# Altium schematic sheet 3_Sensors.schdoc
size 297 x 209 mm; Symbol: Drawing-Symbol_A4; Device: Drawing-Symbol_A4; @Project Name: Irrigation Controller v2; @Page Count: 5; @Update Date: 2026-11-21; @Create Date: 2026-11-21; @Schematic Name: Schematic1; @Page No: 3; @Page Name: 3_Sensors; Company: EasyEDA.com; Version: V1.0; Page Size: A4; @Create Time: 17:28:44; @Update Time: 17:28:44; Border: 1; Width: 1170; Height: 825; Region Start: 1; X Region Count: 6; Y Region Count: 4; Blade Width: 10; Title Block Position: 3; @Board Name: Board1
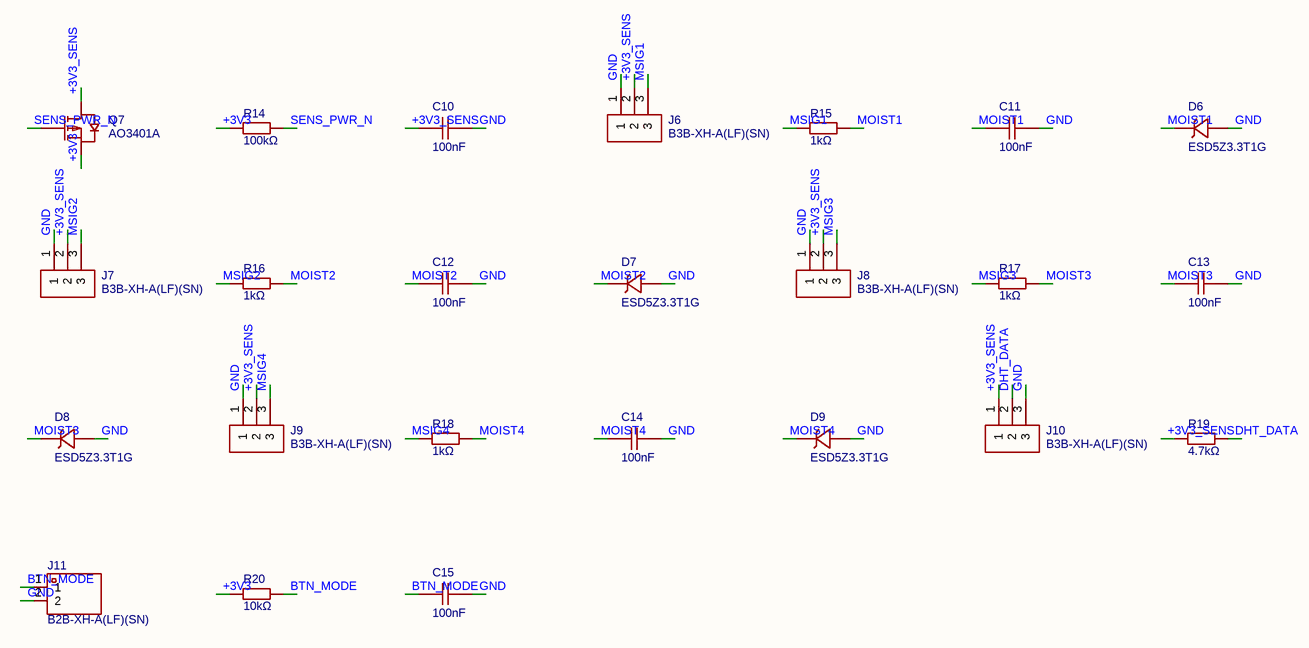
[diagram p0: 3_Sensors.schdoc]

## Parts
C10  100nF  [C0805]
C11  100nF  [C0805]
C12  100nF  [C0805]
C13  100nF  [C0805]
C14  100nF  [C0805]
C15  100nF  [C0805]
D6  ESD5Z3.3T1G  [SOD-523_L1.2-W0.8-LS1.6-FD]
D7  ESD5Z3.3T1G  [SOD-523_L1.2-W0.8-LS1.6-FD]
D8  ESD5Z3.3T1G  [SOD-523_L1.2-W0.8-LS1.6-FD]
D9  ESD5Z3.3T1G  [SOD-523_L1.2-W0.8-LS1.6-FD]
J6  B3B-XH-A(LF)(SN)  [CONN-TH_3P-P2.50_A2501WV2-3P]
J7  B3B-XH-A(LF)(SN)  [CONN-TH_3P-P2.50_A2501WV2-3P]
J8  B3B-XH-A(LF)(SN)  [CONN-TH_3P-P2.50_A2501WV2-3P]
J9  B3B-XH-A(LF)(SN)  [CONN-TH_3P-P2.50_A2501WV2-3P]
J10  B3B-XH-A(LF)(SN)  [CONN-TH_3P-P2.50_A2501WV2-3P]
J11  B2B-XH-A(LF)(SN)  [CONN-TH_B2B-XH-A-LF-SN]
Q7  AO3401A  [SOT-23_L2.9-W1.3-P1.90-LS2.4-BR]
R14  100kΩ  [R0805]
R15  1kΩ  [R0805]
R16  1kΩ  [R0805]
R17  1kΩ  [R0805]
R18  1kΩ  [R0805]
R19  4.7kΩ  [R0805]
R20  10kΩ  [R0805]

## Nets
+3V3: Q7.2(S) R14.1 R20.1
+3V3_SENS: C10.1 J6.2 J7.2 J8.2 J9.2 J10.1 Q7.3(D) R19.1
BTN_MODE: C15.1 J11.1 R20.2
DHT_DATA: J10.2 R19.2
GND: C10.2 C11.2 C12.2 C13.2 C14.2 C15.2 D6.1(A) D7.1(A) D8.1(A) D9.1(A) J6.1 J7.1 J8.1 J9.1 J10.3 J11.2
MOIST1: C11.1 D6.2(K) R15.2
MOIST2: C12.1 D7.2(K) R16.2
MOIST3: C13.1 D8.2(K) R17.2
MOIST4: C14.1 D9.2(K) R18.2
MSIG1: J6.3 R15.1
MSIG2: J7.3 R16.1
MSIG3: J8.3 R17.1
MSIG4: J9.3 R18.1
SENS_PWR_N: Q7.1(G) R14.2

## Notes on the sheet
- Create at
- 2026-11-21
- Schematic
- Board
- Schematic1
- Board1
- Update at
- Page
- 3_Sensors
- Drawn
- Reviewed
- Irrigation Controller v2
- Version
- V1.0
- Size
- A4
- Page  3  Total  5
- EasyEDA.com

## Library data of the parts
C10-C15 = CC0805KRX7R9BB104: Capacitance:100nF Tolerance:±10% Tolerance:±10% Voltage Rating:50V Temperature Coefficient:X7R; Manufacturer: YAGEO(国巨); Add into BOM: yes; PCB Layer: Default; Tolerance: ±10%; Voltage Rating: 50V; Temperature Coefficient: X7R; ModelId: 8c88e81f49c6409b980720ec8953afb6|0819f05c4eef4c71ace90d822a990e87; ModelName: C0805_L2.0-W1.3-H1.3; ModelTransform: 78.74,51.181,0,0,0,0,0,0.0005,0; Symbol: CC0805KRX7R9BB104; Device: CC0805KRX7R9BB104; Convert to PCB: yes; Manufacturer Part: CC0805KRX7R9BB104; Supplier: LCSC; Supplier Part: C49678; LCSC Part Name: 100nF ±10% 50V; Supplier Footprint: 0805; JLCPCB Part Class: Basic Part; Datasheet: https://item.szlcsc.com/datasheet/CC0805KRX7R9BB104/50686.html; Value: 100nF; FootprintName: C0805
D6-D9 = ESD5Z3.3T1G: Polarity:Unidirectional Reverse Stand-Off Voltage (Vrwm):3.3V Clamping Voltage:14V Peak Pulse Current (Ipp):11A Peak Pulse Power Dissipation (Ppp):150W Voltage - Breakdown:5V Reverse Leakage Current (Ir):200nA Number of Channels:1 Operating Temperature:-5; Manufacturer: TECH PUBLIC(台舟); Symbol: ESD5Z3.3T1G_C2827729; Add into BOM: yes; PCB Layer: Default; Reverse Stand-Off Voltage (Vrwm): 3.3V; Clamping Voltage: 14V; Peak Pulse Current (Ipp): 11A; Peak Pulse Power Dissipation (Ppp): 150W; Voltage - Breakdown: 5V; Reverse Leakage Current (Ir): 200nA; Number of Channels: 1; level of protection: IEC 61000-4-2；IEC 61000-4-4; Type: ESD; Junction Capacitance: 110pF; ModelId: c9cd6b3de4464affa41bb10afbd29ee3|0819f05c4eef4c71ace90d822a990e87; ModelName: SOD-523_L1.2-W0.8-H0.7-LS1.6; ModelTransform: 62.992,31.496,0,0,0,0,0,0,0; Device: ESD5Z3.3T1G; Convert to PCB: yes; Manufacturer Part: ESD5Z3.3T1G; Supplier: LCSC; Supplier Part: C2827729; LCSC Part Name: 单向ESD 3.3V截止 峰值浪涌电流：11A; Supplier Footprint: SOD-523; JLCPCB Part Class: Extended Part; Datasheet: https://item.szlcsc.com/datasheet/ESD5Z3.3T1G/2973411.html; Polarity: Unidirectional; Operating Temperature: -55℃~+125℃; FootprintName: SOD-523_L1.2-W0.8-LS1.6-FD
J6-J10 = B3B-XH-A(LF)(SN): Pins Structure:1x3P Pitch:2.5mm Mounting Type:Through Hole Reference Series:XH Number of Pins:3P Number of Rows:1 Number of PINs Per Row:3 Row Spacing:- Current Rating:3A Contact Material:Brass Contact Plating:Tin Operating Temperature:-25℃~+85℃ Operating; Manufacturer: JST; Add into BOM: yes; PCB Layer: Default; Pins Structure: 1x3P; Pitch: 2.5mm; Reference Series: XH; Number of PINs Per Row: 3; Current Rating: 3A; Voltage Rating: 250V; Plastic Material: PA66; Flame Retardant Rating: UL94V-0; Supplementary Features: K Pin; Z-Height of the Board: 7mm; X-Length of Bottom Edge on Board (Spacing Line): 9.9mm; Y-Width of Bottom Edge on Board: 5.75mm; ModelId: 5bef03a823d44d6d8bbe241921219234|0819f05c4eef4c71ace90d822a990e87; ModelTransform: 393.7,226.3775,0,0,0,0,-0.005,-18.465,-125.984; Symbol: B3B-XH-A(LF)(SN); Device: B3B-XH-A(LF)(SN); Convert to PCB: yes; Manufacturer Part: B3B-XH-A(LF)(SN); Supplier: LCSC; Supplier Part: C144394; LCSC Part Name: 1x3P 间距:2.5mm 直插 系列:XH; Supplier Footprint: 插件,P=2.5mm; JLCPCB Part Class: Extended Part; Datasheet: https://item.szlcsc.com/datasheet/B3B-XH-A(LF)(SN)/155726.html; Mounting Type: Through Hole; Number of Pins: 3P; Number of Rows: 1; Row Spacing: -; Contact Material: Brass; Contact Plating: Tin; Operating Temperature: -25℃~+85℃; Color: White; FootprintName: CONN-TH_3P-P2.50_A2501WV2-3P; ModelName: CONN-TH_3P-P2.50_A2501WV2-3P
J11 = B2B-XH-A(LF)(SN): Pins Structure:1x2P Pitch:2.5mm Mounting Type:Through Hole Reference Series:XH Number of Pins:2P Number of Rows:1 Number of PINs Per Row:2 Row Spacing:- Current Rating:3A Contact Material:Brass Contact Plating:Tin Operating Temperature:-25℃~+85℃ Operating; Manufacturer: JST; Add into BOM: yes; PCB Layer: Default; Pins Structure: 1x2P; Pitch: 2.5mm; Reference Series: XH; Number of PINs Per Row: 2; Current Rating: 3A; Voltage Rating: 250V; Plastic Material: PA66; Flame Retardant Rating: UL94V-0; Supplementary Features: K Pin; Z-Height of the Board: 7mm; X-Length of Bottom Edge on Board (Spacing Line): 7.4mm; Y-Width of Bottom Edge on Board: 5.75mm; ModelId: 73bce96024a747fb8562b6dd7d26ab0a|0819f05c4eef4c71ace90d822a990e87; ModelName: XH2.5-2A; ModelTransform: 295.275,224.44837,0,180,0,0,0,18.701,-98.425; Symbol: B2B-XH-A (LF)(SN); Device: B2B-XH-A(LF)(SN); Convert to PCB: yes; Manufacturer Part: B2B-XH-A(LF)(SN); Supplier: LCSC; Supplier Part: C158012; LCSC Part Name: 1x2P 间距:2.5mm 直插 系列:XH; Supplier Footprint: 插件,P=2.5mm; JLCPCB Part Class: Extended Part; Datasheet: https://item.szlcsc.com/datasheet/B2B-XH-A(LF)(SN)/169360.html; Mounting Type: Through Hole; Number of Pins: 2P; Number of Rows: 1; Row Spacing: -; Contact Material: Brass; Contact Plating: Tin; Operating Temperature: -25℃~+85℃; Color: White; FootprintName: CONN-TH_B2B-XH-A-LF-SN
Q7 = AO3401A_C15127: Number:1 P-Channel Drain to Source Voltage:30V Current - Continuous Drain(Id):4A RDS(on):47mΩ@10V；85mΩ@2.5V；60mΩ@4.5V Pd - Power Dissipation:- Gate Threshold Voltage (Vgs(th)):900mV Gate Charge(Qg):14nC@10V Input Capacitance(Ciss):645pF Reverse Transfer C; Manufacturer: AOS; Add into BOM: yes; PCB Layer: Default; Drain to Source Voltage: 30V; Current - Continuous Drain(Id): 4A; Gate Threshold Voltage (Vgs(th)): 900mV; Input Capacitance(Ciss): 645pF; Reverse Transfer Capacitance (Crss@Vds): 55pF; Output Capacitance(Coss): 80pF; ModelId: 62a57c6760504a01965db6419a6d07df|0819f05c4eef4c71ace90d822a990e87; ModelName: SOT-23-3P_L2.9-W1.3-H1.0-LS2.4-P0.95; ModelTransform: 98.64468,114.173,0,180,0,0,0.001,-0.002,0; Symbol: AO3401A; Device: AO3401A_C15127; Convert to PCB: yes; Manufacturer Part: AO3401A; Supplier: LCSC; Supplier Part: C15127; LCSC Part Name: 1个P沟道 耐压:30V 电流:4A; Supplier Footprint: SOT-23; JLCPCB Part Class: Basic Part; Datasheet: https://item.szlcsc.com/datasheet/AO3401A/15801.html; Number: 1 P-Channel; RDS(on): 47mΩ@10V；85mΩ@2.5V；60mΩ@4.5V; Pd - Power Dissipation: -; Gate Charge(Qg): 14nC@10V; Operating Temperature: -; Type: -; FootprintName: SOT-23_L2.9-W1.3-P1.90-LS2.4-BR
R14 = 0805W8F1003T5E (SMT业务专用): Type: Resistance: Tolerance:±1% Tolerance:±1% Power(Watts):- Overload Voltage (Max):-; Manufacturer: UNI-ROYAL(厚声); Add into BOM: yes; PCB Layer: Default; Tolerance: ±1%; ModelId: b83c7c5430874b8eb2319a65d9433429|0819f05c4eef4c71ace90d822a990e87; ModelName: R0805_L2.0-W1.3-H0.6; ModelTransform: 78.74,51.181,0,0,0,0,0,-0.0005,0; Symbol: 0805W8F1003T5E; Device: 0805W8F1003T5E (SMT业务专用); Convert to PCB: yes; Manufacturer Part: 0805W8F1003T5E (SMT业务专用); Supplier: LCSC; Supplier Part: C17407; LCSC Part Name: 100kΩ ±1%; Supplier Footprint: 0805; JLCPCB Part Class: Extended Part; Datasheet: https://atta.szlcsc.com/upload/public/pdf/source/20200102/C423413_58AC64FF5730584578C10BF0002471B1.pdf; Value: 100kΩ; Power(Watts): -; Overload Voltage (Max): -; FootprintName: R0805
R15-R18 = 0805W8F1001T5E: Type:Thick Film Resistors Resistance:1kΩ Tolerance:±1% Tolerance:±1% Power(Watts): Overload Voltage (Max): Temperature Coefficient:±100ppm/℃ Temperature Coefficient:±100ppm/℃ Operating Temperature Range:-55℃~+155℃ Operating Temperature Range:-55℃~+155℃; Manufacturer: UNI-ROYAL(厚声); Add into BOM: yes; PCB Layer: Default; Tolerance: ±1%; ModelId: b83c7c5430874b8eb2319a65d9433429|0819f05c4eef4c71ace90d822a990e87; ModelName: R0805_L2.0-W1.3-H0.6; ModelTransform: 78.74,51.181,0,0,0,0,0,-0.0005,0; Symbol: 0805W8F1001T5E; Device: 0805W8F1001T5E; Convert to PCB: yes; Manufacturer Part: 0805W8F1001T5E; Supplier: LCSC; Supplier Part: C17513; LCSC Part Name: 1kΩ ±1% 125mW 厚膜电阻; Supplier Footprint: 0805; JLCPCB Part Class: Basic Part; Datasheet: https://atta.szlcsc.com/upload/public/pdf/source/20200306/C422600_1E6D84923E4A46A82E41ADD87F860B5C.pdf; Type: Thick Film Resistors; Value: 1kΩ; Temperature Coefficient: ±100ppm/℃; Operating Temperature Range: -55℃~+155℃; FootprintName: R0805
R19 = 0805W8F4701T5E: Type:Thick Film Resistors Resistance:4.7kΩ Tolerance:±1% Tolerance:±1% Power(Watts): Overload Voltage (Max): Temperature Coefficient:±100ppm/℃ Temperature Coefficient:±100ppm/℃ Operating Temperature Range:-55℃~+155℃ Operating Temperature Range:-55℃~+155℃; Manufacturer: UNI-ROYAL(厚声); Add into BOM: yes; PCB Layer: Default; Tolerance: ±1%; ModelId: b83c7c5430874b8eb2319a65d9433429|0819f05c4eef4c71ace90d822a990e87; ModelName: R0805_L2.0-W1.3-H0.6; ModelTransform: 78.74,51.181,0,0,0,0,0,-0.0005,0; Symbol: 0805W8F4701T5E; Device: 0805W8F4701T5E; Convert to PCB: yes; Manufacturer Part: 0805W8F4701T5E; Supplier: LCSC; Supplier Part: C17673; LCSC Part Name: 4.7kΩ ±1% 125mW 厚膜电阻; Supplier Footprint: 0805; JLCPCB Part Class: Basic Part; Datasheet: https://atta.szlcsc.com/upload/public/pdf/source/20200306/C422600_1E6D84923E4A46A82E41ADD87F860B5C.pdf; Type: Thick Film Resistors; Value: 4.7kΩ; Temperature Coefficient: ±100ppm/℃; Operating Temperature Range: -55℃~+155℃; FootprintName: R0805
R20 = 0805W8F1002T5E: Type:Thick Film Resistor Resistance:10kΩ Tolerance:±1% Tolerance:±1% Power(Watts):125mW Voltage-Supply(Max):150V Temperature Coefficient:±100ppm/℃ Temperature Coefficient:±100ppm/℃ Operating Temperature:-55℃~+155℃ Operating Temperature:-55℃~+155℃; Manufacturer: UNI-ROYAL(厚声); Add into BOM: yes; PCB Layer: Default; Tolerance: ±1%; Power(Watts): 125mW; Voltage-Supply(Max): 150V; ModelId: b83c7c5430874b8eb2319a65d9433429|0819f05c4eef4c71ace90d822a990e87; ModelName: R0805_L2.0-W1.3-H0.6; ModelTransform: 78.74,51.181,0,0,0,0,0,-0.0005,0; Symbol: 0805W8F1002T5E; Device: 0805W8F1002T5E; Convert to PCB: yes; Manufacturer Part: 0805W8F1002T5E; Supplier: LCSC; Supplier Part: C17414; LCSC Part Name: 厚膜电阻 10kΩ ±1%; Supplier Footprint: 0805; JLCPCB Part Class: Basic Part; Datasheet: https://item.szlcsc.com/datasheet/0805W8F1002T5E/18102.html; Type: Thick Film Resistor; Value: 10kΩ; Temperature Coefficient: ±100ppm/℃; Operating Temperature: -55℃~+155℃; FootprintName: R0805